# Altium project Task_Tony.PrjPcb (part 4 of 8)

## Sheet USB_Host.SchDoc
size A4; DocumentNumber: 25; SheetNumber: 25; SheetTotal: 28
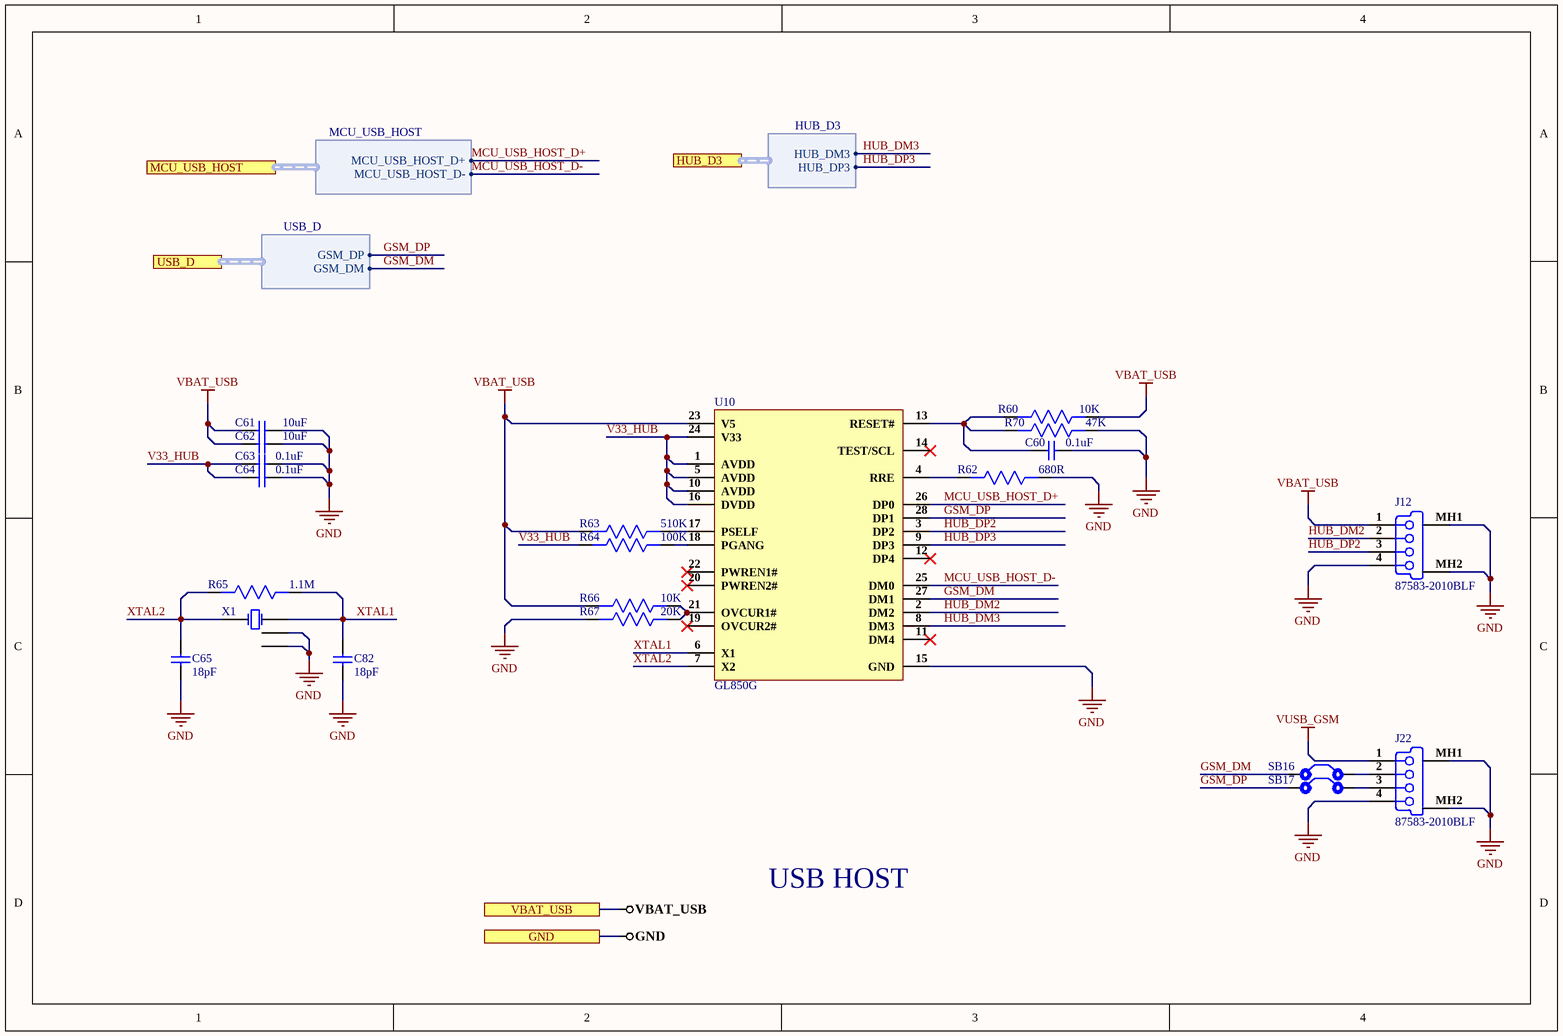
[diagram p18: USB_Host.SchDoc]

### Parts
C60  0.1uF  [Cap0603]
C61  10uF  [Cap0603]
C62  10uF  [Cap0603]
C63  0.1uF  [Cap0603]
C64  0.1uF  [Cap0603]
C65  18pF  [Cap0603]
C82  18pF  [Cap0603]
J12  87583-2010BLF  [87583-2010BLF]
J22  87583-2010BLF  [87583-2010BLF]
R60  10K  [Res0603]
R62  680R  [Res0603]
R63  510K  [Res0603]
R64  100K  [Res0603]
R65  1.1M  [Res0603]
R66  10K  [Res0603]
R67  20K  [Res0603]
R70  47K  [Res-0201]
SB16  Solder Bridge  [Solder Bridge]  (value not drawn)
SB17  Solder Bridge  [Solder Bridge]  (value not drawn)
U10  GL850G  [SSOP-28]
X1  8Z-12.000MAAJ-T  [8Z-12.000MAAJ-T]  (value not drawn)

### Ports
GND, HUB_D3 (harness HUB_D3), MCU_USB_HOST (harness MCU_USB_HOST), USB_D (harness USB_D), VBAT_USB

### Harnesses
MCU_USB_HOST: MCU_USB_HOST_D+, MCU_USB_HOST_D-
HUB_D3: HUB_DM3, HUB_DP3
USB_D: GSM_DP, GSM_DM

### Nets
GND: C60.2 C61.2 C62.2 C63.2 C64.2 C65.1 C82.1 J12.4(GND) J12.MH1(Tab) J12.MH2(Tab) J22.4(GND) J22.MH1(Tab) J22.MH2(Tab) R62.1 R67.2 R70.1 U10.15(GND) X1.2(GND) X1.4(GND) ; port GND
VBAT_USB: C61.1 C62.1 J12.1(V_BUS_(5V)) R60.1 R63.2 R66.2 U10.23(V5) ; port VBAT_USB
VUSB_GSM: J22.1(V_BUS_(5V))
GSM_DM: SB16.1 U10.27(DM1) ; port USB_D.GSM_DM
GSM_DP: SB17.1 U10.28(DP1) ; port USB_D.GSM_DP
HUB_DM2: J12.2(D-) U10.2(DM2)
HUB_DM3: U10.8(DM3) ; port HUB_D3.HUB_DM3  [project net HUB_D3.HUB_DM3]
HUB_DP2: J12.3(D+) U10.3(DP2)
HUB_DP3: U10.9(DP3) ; port HUB_D3.HUB_DP3  [project net HUB_D3.HUB_DP3]
MCU_USB_HOST_D+: U10.26(DP0) ; port MCU_USB_HOST.MCU_USB_HOST_D+  [project net MCU_USB_HOST.MCU_USB_HOST_D+]
MCU_USB_HOST_D-: U10.25(DM0) ; port MCU_USB_HOST.MCU_USB_HOST_D-  [project net MCU_USB_HOST.MCU_USB_HOST_D-]
V33_HUB: C63.1 C64.1 R64.2 U10.1(AVDD) U10.5(AVDD) U10.10(AVDD) U10.16(DVDD) U10.24(V33)
XTAL1: C82.2 R65.1 U10.6(X1) X1.1(OSC1)
XTAL2: C65.2 R65.2 U10.7(X2) X1.3(OSC2)
NetC60_1: C60.1 R60.2 R70.2 U10.13(RESET#)
NetJ22_2: J22.2(D-) SB16.2
NetJ22_3: J22.3(D+) SB17.2
NetR62_2: R62.2 U10.4(RRE)
NetR63_1: R63.1 U10.17(PSELF)
NetR64_1: R64.1 U10.18(PGANG)
NetR66_1: R66.1 R67.1 U10.21(OVCUR1#)

Not connected (* = marked no-connect by the designer): U10 11(DM4)* 12(DP4)* 14(TEST/SCL)* 19(OVCUR2#)* 20(PWREN2#)* 22(PWREN1#)*

### Notes on the sheet
- USB HOST

### Library data of the parts
C60 C63 C64 = CC0603ZRY5V9BB104: as C40 on sheet USB_Power; Supplier 1: Digi-Key; Manufacturer Part Number: CC0603ZRY5V9BB104; Stock 1: 15000880; Pricing 1: 1=0.1, 10=0.075, 100=0.0334, 500=0.02386, 1000=0.01874 (USD); Mount: Surface Mount; Case/Package: 0603; Number of Pins: 2; Case Code (Metric): 1608; Case Code (Imperial): 0603; Min Operating Temperature: -30°C; Max Operating Temperature: 85°C; Dielectric: Y5V; Voltage Rating: 50V; Package Quantity: 1; Packaging: Tape and Reel; Voltage Rating (DC): 50V; Termination: SMD/SMT; Composition: Ceramic; Voltage: 50V; Length: 1.6mm; Height: 0.8mm; Width: 0.031inch; Thickness: 0.035inch; Depth: 0.8mm; Radiation Hardening: No; REACH SVHC: No SVHC; Lead Free: Lead Free; Halogen Free: Halogen Free; ComponentLink1URL: http://www.yageo.com/documents/recent/UPY-GPHC_Y5V_6.3V-to-50V_8.pdf?src-supplier=Digi-Key; ComponentLink1Description: http://www.yageo.com/documents/recent/UPY-GPHC_Y5V_6.3V-to-50V_8.pdf?src-supplier=Digi-Key; ComponentLink2URL: http://www.yageo.com/documents/recent/UPY-GPHC_Y5V_6.3V-to-50V_5.pdf?src-supplier=Avnet+Europe; ComponentLink2Description: http://www.yageo.com/documents/recent/UPY-GPHC_Y5V_6.3V-to-50V_5.pdf?src-supplier=Avnet+Europe; ComponentLink3URL: https://www.verical.com/server-webapp/html/getDatasheet?partID=403611&src-supplier=Verical; ComponentLink3Description: https://www.verical.com/server-webapp/html/getDatasheet?partID=403611&src-supplier=Verical; ComponentLink4URL: http://www.mouser.com/ds/2/447/Yageo_UPY-GP_NP0_16V-to-50V_9-358835.pdf?src-supplier=Mouser; ComponentLink4Description: http://www.mouser.com/ds/2/447/Yageo_UPY-GP_NP0_16V-to-50V_9-358835.pdf?src-supplier=Mouser; ComponentLink5URL: http://www.farnell.com/datasheets/1132289.pdf?src-supplier=Element14; ComponentLink5Description: http://www.farnell.com/datasheets/1132289.pdf?src-supplier=Element14; Supplier Part Number 1: 311-1343-1-ND
C61 C62 = GRM188R6YA106MA73D: as C89 on sheet USB_Power; Supplier 1: Digi-Key; Manufacturer Part Number: GRM188R6YA106MA73D; Stock 1: 11640; Pricing 1: 1=0.5, 10=0.346, 100=0.2076, 500=0.1557, 1000=0.13148 (USD); Mount: Surface Mount; Case/Package: 0603; Case Code (Metric): 1608; Case Code (Imperial): 0603; Min Operating Temperature: -55°C; Max Operating Temperature: 85°C; Packaging: Tape and Reel; Capacitance: 10uF; Voltage Rating: 35V; Voltage Rating (DC): 35V; Dielectric: X5R; Length: 0.063inch; Width: 0.031inch; Thickness: 0.039inch; ComponentLink1URL: http://search.murata.co.jp/Ceramy/image/img/A01X/G101/ENG/GRM188R6YA106MA73-01.pdf?src-supplier=Digi-Key; ComponentLink1Description: http://search.murata.co.jp/Ceramy/image/img/A01X/G101/ENG/GRM188R6YA106MA73-01.pdf?src-supplier=Digi-Key; ComponentLink2URL: http://search.murata.co.jp/Ceramy/image/img/A01X/G101/ENG/GRM188R6YA106MA73-01.pdf?src-supplier=Mouser; ComponentLink2Description: http://search.murata.co.jp/Ceramy/image/img/A01X/G101/ENG/GRM188R6YA106MA73-01.pdf?src-supplier=Mouser; ComponentLink3URL: https://www.murata.com/~/media/webrenewal/support/library/catalog/products/capacitor/mlcc/c02e.ashx?la=en-us&src-supplier=Digi-Key; ComponentLink3Description: https://www.murata.com/~/media/webrenewal/support/library/catalog/products/capacitor/mlcc/c02e.ashx?la=en-us&src-supplier=Digi-Key; ComponentLink4URL: http://search.murata.co.jp/Ceramy/image/img/A01X/G101/ENG/GRM188R6YA106MA73-01.pdf?src-supplier=Future+Electronics; ComponentLink4Description: http://search.murata.co.jp/Ceramy/image/img/A01X/G101/ENG/GRM188R6YA106MA73-01.pdf?src-supplier=Future+Electronics; ComponentLink5URL: http://search.murata.co.jp/Ceramy/image/img/A01X/G101/ENG/GRM188R6YA106MA73-01.pdf?src-supplier=TTI; ComponentLink5Description: http://search.murata.co.jp/Ceramy/image/img/A01X/G101/ENG/GRM188R6YA106MA73-01.pdf?src-supplier=TTI; Supplier Part Number 1: 490-13248-6-ND
C65 C82 = C0603C180J5GACTU: CAP CER 18PF 50V C0G/NP0 0603; Manufacturer: KEMET; Dielectric Material: Ceramic; Tolerance: 5%; Dielectric: C0G; Dissipation Factor: 0.1%; Temperature Coefficient: 30ppm/°C; Supplier 1: Digi-Key; Manufacturer Part Number: C0603C180J5GACTU; Stock 1: 196781; Pricing 1: 1=0.1, 10=0.049, 100=0.0217, 500=0.01552, 1000=0.01219 (USD); Mount: Surface Mount; Case/Package: 0603; Case Code (Imperial): 0603; Case Code (Metric): 1608; Min Operating Temperature: -55°C; Max Operating Temperature: 125°C; Packaging: Tape and Reel; Capacitance: 18pF; Package Quantity: 4000; Voltage Rating: 50V; Voltage Rating (DC): 50V; Termination: SMD/SMT; Voltage: 50V; Length: 1.6mm; Height: 0.8mm; Width: 0.8mm; Depth: 0.8mm; Radiation Hardening: No; Lead Free: Lead Free; ComponentLink1URL: http://www.kemet.com/kemet/web/homepage/kechome.nsf/file/F9080B_0402_Series_C0G/$file/F9080B_0402_Series_C0G.pdf?src-supplier=Element14; ComponentLink1Description: http://www.kemet.com/kemet/web/homepage/kechome.nsf/file/F9080B_0402_Series_C0G/$file/F9080B_0402_Series_C0G.pdf?src-supplier=Element14; ComponentLink2URL: http://www.farnell.com/datasheets/1372242.pdf?src-supplier=Element14; ComponentLink2Description: http://www.farnell.com/datasheets/1372242.pdf?src-supplier=Element14; Supplier Part Number 1: 399-1052-1-ND
J12 J22 = 87583-2010BLF: USB Connectors 4P RECEPTACLE TYPE A; Manufacturer: Amphenol FCI; Plating: Nickel; Number of Terminals/Pins: 4; Current Rating: 1A; Mating Cycles: 1500; Connector Type: USB,Receptacle; Number of Ports: 1; Contact Resistance: 30mR; Insulation Resistance: 1GR; USB Standard: USB 2.0; Supplier 1: Allied Electronics; Manufacturer Part Number: 87583-2010BLF; RoHS: Yes; Category: Connectors; Mount: Surface Mount,Horizontal; Contact Plating: GXT,Gold; Color: White; Contact Material: Copper Alloy; Body Plating: Nickel; Material: Tin; Housing Material: Thermoplastic; Min Operating Temperature: 0°C; Max Operating Temperature: 40°C; Termination: Solder; Gender: Receptacle; Packaging: Rail/Tube; Number of Contacts: 4; Orientation: Right Angle; Package Quantity: 42; Interface: USB; Number of Positions: 4; Series: 87583; Length: 14.5mm; Depth: 14mm; Radiation Hardening: No; Flammability Rating: UL94 V-0; REACH SVHC: No SVHC; RoHS Compliant: Yes; ComponentLink1URL: https://datasheet.ciiva.com/851/87583-851211.pdf?src-supplier=Digi-Key; ComponentLink1Description: https://datasheet.ciiva.com/851/87583-851211.pdf?src-supplier=Digi-Key; ComponentLink2URL: https://datasheet.ciiva.com/1100/57319-1100818.pdf?src-supplier=Newark; ComponentLink2Description: https://datasheet.ciiva.com/1100/57319-1100818.pdf?src-supplier=Newark; ComponentLink3URL: https://datasheet.ciiva.com/25614/0900766b8118e6e2-25614557.pdf?src-supplier=RSComponents; ComponentLink3Description: https://datasheet.ciiva.com/25614/0900766b8118e6e2-25614557.pdf?src-supplier=RSComponents; ComponentLink4URL: https://datasheet.ciiva.com/4599/gs-12-095-532824-4599287.pdf?src-supplier=Mouser; ComponentLink4Description: https://datasheet.ciiva.com/4599/gs-12-095-532824-4599287.pdf?src-supplier=Mouser; ComponentLink5URL: https://datasheet.ciiva.com/15181/getdatasheetpartid-106468-15181159.pdf?src-supplier=Verical; ComponentLink5Description: https://datasheet.ciiva.com/15181/getdatasheetpartid-106468-15181159.pdf?src-supplier=Verical; ComponentLink6URL: https://datasheet.ciiva.com/3094/87583-3094440.pdf?src-supplier=Avnet; ComponentLink6Description: https://datasheet.ciiva.com/3094/87583-3094440.pdf?src-supplier=Avnet; ComponentLink7URL: https://datasheet.ciiva.com/14619/70236897-14619037.pdf?src-supplier=Allied+Electronics; ComponentLink7Description: https://datasheet.ciiva.com/14619/70236897-14619037.pdf?src-supplier=Allied+Electronics; Supplier Part Number 1: 70236897
R60 R66 = AC0603JR-0710KL: RES SMD 10K OHM 5% 1/10W 0603; Manufacturer: Yageo; Voltage Rating: 50V; Resistance: 10kR; Power Rating: 100mW; Temperature Coefficient: 100ppm/°C; Supplier 1: Future Electronics; Manufacturer Part Number: AC0603JR-0710KL; RoHS: Yes; Category: Chip SMD Resistors; Stock 1: 1533000; Pricing 1: 5000=0.00540 (USD); Case/Package: 0603; Case Code (Imperial): 0603; Case Code (Metric): 1608; Size Code: 0603; Min Operating Temperature: -55°C; Max Operating Temperature: 155°C; Packaging: Tape and Reel; Tolerance: 5%; Package Quantity: 1; Resistor Type: Thick Film; Termination: SMD/SMT; Number of Terminations: 2; Max Power Dissipation: 100mW; Features: Moisture Resistant,Automotive AEC-Q200,Anti-Sulfur; Series: AC; Construction: Rectangular; Length: 0.063inch; Width: 0.031inch; Height: 0.022inch; Depth: 0.8mm; Military Standard: Not; Lead Free: Lead Free; RoHS Compliant: Yes; ComponentLink1URL: https://datasheet.ciiva.com/5562/pyu-ac-51-rohs-l-2-5562553.pdf?src-supplier=Mouser; ComponentLink1Description: https://datasheet.ciiva.com/5562/pyu-ac-51-rohs-l-2-5562553.pdf?src-supplier=Mouser; Supplier Part Number 1: 1029044
R62 = RC0603FR-07680RL: RES SMD 680 OHM 1% 1/10W 0603; Manufacturer: Yageo; Temperature Coefficient: 100ppm/°C; Voltage Rating (DC): 50V; Power Rating: 100mW; Supplier 1: Digi-Key; Manufacturer Part Number: RC0603FR-07680RL; Stock 1: 4278227; Pricing 1: 1=0.1, 10=0.024, 100=0.0097, 1000=0.00437, 2500=0.00379 (USD); Case/Package: 0603; Number of Pins: 2; Case Code (Imperial): 0603; Case Code (Metric): 1608; Min Operating Temperature: -55°C; Max Operating Temperature: 155°C; Resistance: 680R; Tolerance: 1%; Composition: Thick Film; Packaging: Tape and Reel; Number of Terminations: 2; Military Standard: Not; Voltage Rating: 50V; Package Quantity: 1; Termination: SMD/SMT; Max Power Dissipation: 100mW; Features: Moisture Resistant; Length: 1.6mm; Height: 0.022inch; Width: 0.031inch; Depth: 0.8mm; REACH SVHC: No SVHC; Lead Free: Lead Free; ComponentLink1URL: http://www.farnell.com/datasheets/1868787.pdf?src-supplier=Element14; ComponentLink1Description: http://www.farnell.com/datasheets/1868787.pdf?src-supplier=Element14; ComponentLink2URL: http://documents.rs-components.com/techlib://itc_doclist_GB.htm?stockno=5048221&src-supplier=RSComponents; ComponentLink2Description: http://documents.rs-components.com/techlib://itc_doclist_GB.htm?stockno=5048221&src-supplier=RSComponents; ComponentLink3URL: http://www.farnell.com/datasheets/443971.pdf?src-supplier=Element14; ComponentLink3Description: http://www.farnell.com/datasheets/443971.pdf?src-supplier=Element14; ComponentLink4URL: http://www.yageo.com/documents/recent/PYu-RC_Group_51_RoHS_L_10.pdf?src-supplier=Digi-Key; ComponentLink4Description: http://www.yageo.com/documents/recent/PYu-RC_Group_51_RoHS_L_10.pdf?src-supplier=Digi-Key; Supplier Part Number 1: 311-680HRCT-ND
R63 = RK73B1JTTD514J: RES 510K OHM 5% 1/10W 0603; Manufacturer: KOA Speer; Resistance: 510kR; Power Rating: 100mW; Voltage Rating: 50V; Temperature Coefficient: 200ppm/°C; Supplier 1: Digi-Key; Manufacturer Part Number: RK73B1JTTD514J; RoHS: Yes; Category: Chip SMD Resistors; Stock 1: 50000; Pricing 1: 1=0.10000, 10=0.01400, 100=0.00580, 1000=0.00262, 2500=0.00228 (USD); Case/Package: 0603; Case Code (Imperial): 0603; Case Code (Metric): 1608; Min Operating Temperature: -55°C; Max Operating Temperature: 155°C; Packaging: Tape and Reel; Tolerance: 5%; Package Quantity: 5000; Resistor Type: Thick Film; Termination: SMD/SMT; Voltage Rating (DC): 50V; Series: RK73B; Technology: THICK FILM; Resistance Tolerance: 5%; Construction: Rectangular; Length: 1.6mm; Width: 0.8mm; Height: 0.45mm; Depth: 0.8mm; REACH SVHC: Unknown; Military Standard: Not; Lead Free: Lead Free; RoHS Compliant: Yes; ComponentLink1URL: https://datasheet.ciiva.com/5555/rk73b-5555496.pdf?src-supplier=Mouser; ComponentLink1Description: https://datasheet.ciiva.com/5555/rk73b-5555496.pdf?src-supplier=Mouser; ComponentLink2URL: https://datasheet.ciiva.com/7763/548635-7763065.pdf?src-supplier=Element14; ComponentLink2Description: https://datasheet.ciiva.com/7763/548635-7763065.pdf?src-supplier=Element14; ComponentLink3URL: https://datasheet.ciiva.com/15202/getdatasheetpartid-423620-15202714.pdf?src-supplier=Verical; ComponentLink3Description: https://datasheet.ciiva.com/15202/getdatasheetpartid-423620-15202714.pdf?src-supplier=Verical; Supplier Part Number 1: 2019-RK73B1JTTD514JCT-ND
R64 = CRGH0603J100K: RES SMD 100K OHM 5% 1/5W 0603; Manufacturer: TE Connectivity; Resistance: 100kR; Temperature Coefficient: 100ppm/°C; Power Rating: 200mW; Voltage Rating: 50V; Number of Resistors: 1; Supplier 1: Digi-Key; Manufacturer Part Number: CRGH0603J100K; Stock 1: 23277; Pricing 1: 1=0.1, 10=0.049, 100=0.02, 1000=0.00899, 2500=0.0078 (USD); Mount: Surface Mount; Case/Package: 0603; Case Code (Imperial): 0603; Case Code (Metric): 1608; Min Operating Temperature: -55°C; Max Operating Temperature: 125°C; Tolerance: 5%; Packaging: Tape and Reel; Resistor Type: Thick Film,Power resistor; Number of Terminations: 2; Series: CRGH; Termination: Solder; Voltage Rating (DC): 50V; Resistance Tolerance: 5%; Technology: THICK FILM; Length: 1.6mm; Width: 0.8mm; Height: 0.45mm; Depth: 0.8mm; RoHS Compliant: Yes; REACH SVHC: No SVHC; ELV: Compliant; ComponentLink1URL: http://www.farnell.com/datasheets/2007183.pdf?src-supplier=Element14; ComponentLink1Description: http://www.farnell.com/datasheets/2007183.pdf?src-supplier=Element14; Supplier Part Number 1: A126393DKR-ND
R65 = RC0603FR-071M1L: RES SMD 1.1M OHM 1% 1/10W 0603; Manufacturer: Yageo; Resistance: 1.1MR; Temperature Coefficient: 100ppm/°C; Power Rating: 100mW; Voltage Rating: 50V; Supplier 1: Digi-Key; Manufacturer Part Number: RC0603FR-071M1L; RoHS: Yes; Category: Chip SMD Resistors; Stock 1: 137699; Pricing 1: 1=0.10000, 10=0.02400, 100=0.00970, 1000=0.00436, 2500=0.00378 (USD); Mount: Surface Mount; Case/Package: 0603; Contact Plating: Tin,Matte; Case Code (Imperial): 0603; Case Code (Metric): 1608; Size Code: 0603; Min Operating Temperature: -55°C; Max Operating Temperature: 155°C; Tolerance: 1%; Resistor Type: Thick Film; Packaging: Tape and Reel; Number of Terminations: 2; Termination: SMD/SMT; Max Power Dissipation: 100mW; Features: Moisture Resistant; Series: RC; Technology: THICK FILM; Construction: Rectangular; Length: 1.6mm; Width: 0.031inch; Height: 0.45mm; Depth: 0.8mm; Military Standard: Not; Lead Free: Lead Free; RoHS Compliant: Yes; ComponentLink1URL: https://datasheet.ciiva.com/11808/0900766b80c66297-11808821.pdf?src-supplier=RSComponents; ComponentLink1Description: https://datasheet.ciiva.com/11808/0900766b80c66297-11808821.pdf?src-supplier=RSComponents; ComponentLink2URL: https://datasheet.ciiva.com/28419/pyu-rc0603-51-rohs-l-4-28419097.pdf?src-supplier=Avnet+Europe; ComponentLink2Description: https://datasheet.ciiva.com/28419/pyu-rc0603-51-rohs-l-4-28419097.pdf?src-supplier=Avnet+Europe; ComponentLink3URL: https://datasheet.ciiva.com/12560/rc0603-272842-12560493.pdf?src-supplier=Mouser; ComponentLink3Description: https://datasheet.ciiva.com/12560/rc0603-272842-12560493.pdf?src-supplier=Mouser; Supplier Part Number 1: YAG3324CT-ND
R67 = ESR03EZPF2002: RES SMD 20K OHM 1% 1/4W 0603; Manufacturer: Rohm; Resistance: 20kR; Max Power Dissipation: 250mW; Temperature Coefficient: 100ppm/°C; Supplier 1: Digi-Key; Manufacturer Part Number: ESR03EZPF2002; Stock 1: 4737; Pricing 1: 1=0.13, 10=0.12, 100=0.046, 1000=0.02024, 2500=0.01748 (USD); Case/Package: 0603; Case Code (Metric): 1608; Case Code (Imperial): 0603; Min Operating Temperature: -55°C; Max Operating Temperature: 155°C; Package Quantity: 1; Tolerance: 1%; Packaging: Tape and Reel; Resistor Type: Thick Film; Number of Terminations: 2; Features: Automotive AEC-Q200; Series: ESR; Length: 0.063inch; Width: 0.031inch; Height: 0.022inch; RoHS Compliant: Yes; ComponentLink1URL: https://www.rohm.com/datasheet/ESR01MZPF/esr-e?src-supplier=Digi-Key; ComponentLink1Description: https://www.rohm.com/datasheet/ESR01MZPF/esr-e?src-supplier=Digi-Key; Supplier Part Number 1: RHM20.0KADCT-ND
R70 = RC0201JR-0747KL: RES SMD 47K OHM 5% 1/20W 0201; Manufacturer: Yageo; Resistance: 47kR; Temperature Coefficient: 200ppm/°C; Voltage Rating: 25V; Power Rating: 50mW; Supplier 1: Digi-Key; Manufacturer Part Number: RC0201JR-0747KL; RoHS: Yes; Category: Chip SMD Resistors; Stock 1: 472205; Pricing 1: 1=0.10000, 10=0.02800, 100=0.01140, 1000=0.00513, 2500=0.00445, 5000=0.00368 (USD); Case/Package: 0201; Number of Pins: 2; Contact Plating: Tin,Matte; Case Code (Metric): 0603; Case Code (Imperial): 0201; Min Operating Temperature: -55°C; Max Operating Temperature: 125°C; Tolerance: 5%; Resistor Type: Thick Film; Package Quantity: 10000; Packaging: Tape and Reel; Number of Terminations: 2; Termination: SMD/SMT; Max Power Dissipation: 50mW; Voltage Rating (DC): 25V; Working Voltage: 25V; Features: Moisture Resistant; Series: RC; Resistance Tolerance: 5%; Construction: Rectangular; Technology: THICK FILM; Length: 0.6mm; Width: 0.3mm; Height: 0.01inch; Depth: 0.3mm; Radiation Hardening: No; REACH SVHC: No SVHC; Military Standard: Not; Lead Free: Lead Free; RoHS Compliant: Yes; ComponentLink1URL: https://datasheet.ciiva.com/2492/pyu-r-int-thick-7-2492966.pdf?src-supplier=Digi-Key; ComponentLink1Description: https://datasheet.ciiva.com/2492/pyu-r-int-thick-7-2492966.pdf?src-supplier=Digi-Key; ComponentLink2URL: https://datasheet.ciiva.com/5989/1563626-5989624.pdf?src-supplier=Farnell; ComponentLink2Description: https://datasheet.ciiva.com/5989/1563626-5989624.pdf?src-supplier=Farnell; ComponentLink3URL: https://datasheet.ciiva.com/28399/pyu-rc0201-51-rohs-l-8-28399338.pdf?src-supplier=Avnet+Europe; ComponentLink3Description: https://datasheet.ciiva.com/28399/pyu-rc0201-51-rohs-l-8-28399338.pdf?src-supplier=Avnet+Europe; ComponentLink4URL: https://datasheet.ciiva.com/8889/pyu-rc0201-51-rohs-l-8-8889071.pdf?src-supplier=Avnet; ComponentLink4Description: https://datasheet.ciiva.com/8889/pyu-rc0201-51-rohs-l-8-8889071.pdf?src-supplier=Avnet; ComponentLink5URL: https://datasheet.ciiva.com/2492/pyu-r-int-thick-7-2492965.pdf?src-supplier=Digi-Key; ComponentLink5Description: https://datasheet.ciiva.com/2492/pyu-r-int-thick-7-2492965.pdf?src-supplier=Digi-Key; ComponentLink6URL: https://datasheet.ciiva.com/2492/pyu-r-int-thick-7-2492967.pdf?src-supplier=Digi-Key; ComponentLink6Description: https://datasheet.ciiva.com/2492/pyu-r-int-thick-7-2492967.pdf?src-supplier=Digi-Key; ComponentLink7URL: https://datasheet.ciiva.com/16855/pyu-rc0201-51-rohs-l-8-16855517.pdf?src-supplier=Avnet+Europe; ComponentLink7Description: https://datasheet.ciiva.com/16855/pyu-rc0201-51-rohs-l-8-16855517.pdf?src-supplier=Avnet+Europe; Supplier Part Number 1: 311-47KNCT-ND
SB16 SB17 = Solder Bridge: Solder Bridge ON
U10 = GL850G: USB 2.0 Hub Controller
X1 = 8Z-12.000MAAJ-T: CRYSTAL 12.0000MHZ 18PF SMD; Manufacturer: TXC; Frequency: 12MHz; Frequency Tolerance: 30ppm; ESR (Equivalent Series Resistance): 150R; Supplier 1: Mouser; Manufacturer Part Number: 8Z-12.000MAAJ-T; RoHS: Yes; Category: Crystals; Stock 1: 33; Pricing 1: 1=1.41000, 10=1.36000, 50=1.33000, 100=1.13000, 1000=0.93000, 10000=0.78000 (USD); Mount: Surface Mount; Case/Package: SMD/SMT; Number of Pins: 4; Min Operating Temperature: -20°C; Max Operating Temperature: 70°C; Package Quantity: 1; Load Capacitance: 18pF; Packaging: Tape and Reel; Tolerance: 30ppm; Frequency Stability: 30ppm; Termination: SMD/SMT; Series: 8Z; Length: 2.5mm; Width: 0.079inch; Height: 0.022inch; Depth: 2mm; REACH SVHC: No SVHC; RoHS Compliant: Yes; ComponentLink1URL: https://datasheet.ciiva.com/28498/1838674-28498900.pdf?src-supplier=Element14; ComponentLink1Description: https://datasheet.ciiva.com/28498/1838674-28498900.pdf?src-supplier=Element14; ComponentLink2URL: https://datasheet.ciiva.com/4950/8z-12784-4950167.pdf?src-supplier=Mouser; ComponentLink2Description: https://datasheet.ciiva.com/4950/8z-12784-4950167.pdf?src-supplier=Mouser; ComponentLink3URL: https://datasheet.ciiva.com/859/8z-859073.pdf?src-supplier=Digi-Key; ComponentLink3Description: https://datasheet.ciiva.com/859/8z-859073.pdf?src-supplier=Digi-Key; ComponentLink4URL: https://datasheet.ciiva.com/859/8z-859071.pdf?src-supplier=Digi-Key; ComponentLink4Description: https://datasheet.ciiva.com/859/8z-859071.pdf?src-supplier=Digi-Key; ComponentLink5URL: https://datasheet.ciiva.com/859/8z-859072.pdf?src-supplier=Digi-Key; ComponentLink5Description: https://datasheet.ciiva.com/859/8z-859072.pdf?src-supplier=Digi-Key; ComponentLink6URL: https://datasheet.ciiva.com/8047/1041872-8047871.pdf?src-supplier=Element14; ComponentLink6Description: https://datasheet.ciiva.com/8047/1041872-8047871.pdf?src-supplier=Element14; Supplier Part Number 1: 717-8Z-12.000MAAJ-T

## Sheet Camera_Section.SchDoc
size A4; DocumentNumber: 18; SheetNumber: 18; SheetTotal: 28
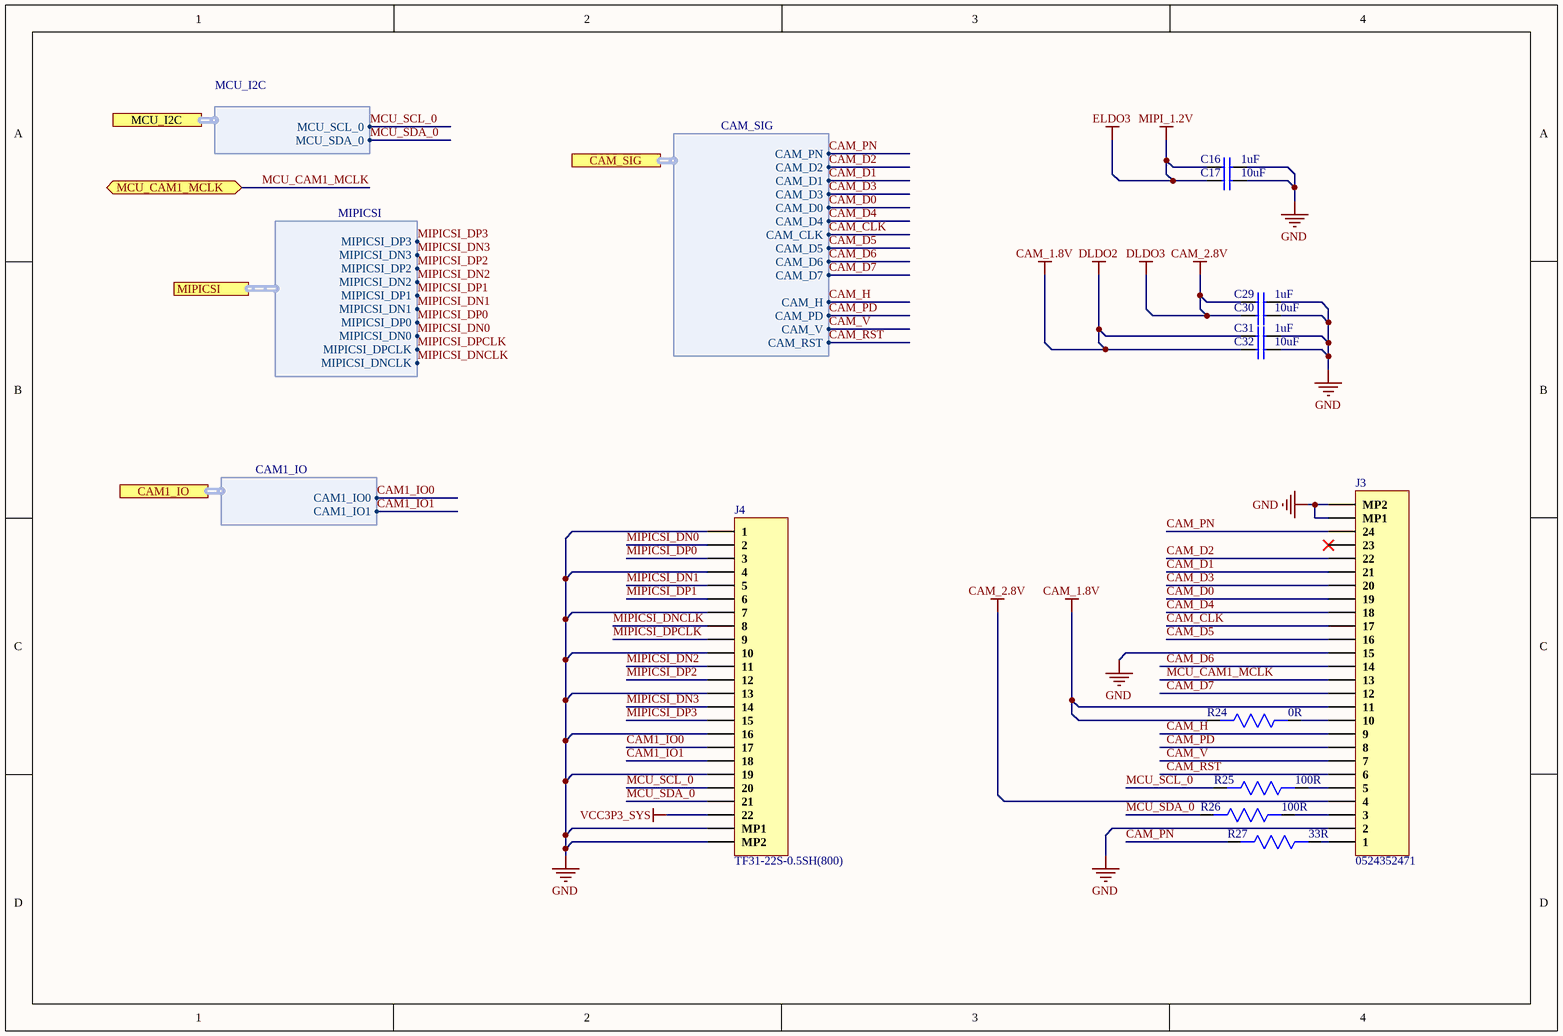
[diagram p19: Camera_Section.SchDoc]

### Parts
C16  1uF  [Cap0603]
C17  10uF  [Cap0603]
C29  1uF  [Cap0603]
C30  10uF  [Cap0603]
C31  1uF  [Cap0603]
C32  10uF  [Cap0603]
J3  0524352471  [0524352471]
J4  TF31-22S-0.5SH(800)  [TF31-22S-0.5SH(800)]
R24  0R  [Res0603]
R25  100R  [Res0603]
R26  100R  [Res0603]
R27  33R  [Res0603]

### Ports
CAM1_IO (harness CAM1_IO), CAM_SIG (harness CAM_SIG), MCU_CAM1_MCLK (bidir), MCU_I2C (harness MCU_I2C), MIPICSI (harness MIPICSI)

### Harnesses
MCU_I2C: MCU_SCL_0, MCU_SDA_0
CAM_SIG: CAM_PN, CAM_D2, CAM_D1, CAM_D3, CAM_D4, CAM_D5, CAM_D6, CAM_D7, CAM_H, CAM_PD, CAM_V, CAM_RST, CAM_CLK, CAM_D0
MIPICSI: MIPICSI_DP3, MIPICSI_DN3, MIPICSI_DP2, MIPICSI_DN2, MIPICSI_DP1, MIPICSI_DN1, MIPICSI_DP0, MIPICSI_DN0, MIPICSI_DPCLK, MIPICSI_DNCLK
CAM1_IO: CAM1_IO0, CAM1_IO1

### Nets
CAM_1.8V: C31.1 C32.1 J3.11 R24.2  [also labelled DLDO2]
CAM_2.8V: C29.1 C30.1 J3.4  [also labelled DLDO3]
ELDO3: C16.1 C17.1  [also labelled MIPI_1.2V]
GND: C16.2 C17.2 C29.2 C30.2 C31.2 C32.2 J3.2 J3.15 J3.MP1 J3.MP2 J4.1 J4.4 J4.7 J4.10 J4.13 J4.16 J4.19 J4.MP1 J4.MP2
VCC3P3_SYS: J4.22  [project net VCC 3P3_SYS]
CAM1_IO0: J4.17 ; port CAM1_IO.CAM1_IO0  [project net CAM1_IO.CAM1_IO0]
CAM1_IO1: J4.18 ; port CAM1_IO.CAM1_IO1  [project net CAM1_IO.CAM1_IO1]
CAM_CLK: J3.17 ; port CAM_SIG.CAM_CLK
CAM_D0: J3.19 ; port CAM_SIG.CAM_D0
CAM_D1: J3.21 ; port CAM_SIG.CAM_D1
CAM_D2: J3.22 ; port CAM_SIG.CAM_D2
CAM_D3: J3.20 ; port CAM_SIG.CAM_D3
CAM_D4: J3.18 ; port CAM_SIG.CAM_D4
CAM_D5: J3.16 ; port CAM_SIG.CAM_D5
CAM_D6: J3.14 ; port CAM_SIG.CAM_D6
CAM_D7: J3.12 ; port CAM_SIG.CAM_D7
CAM_H: J3.9 ; port CAM_SIG.CAM_H
CAM_PD: J3.8 ; port CAM_SIG.CAM_PD
CAM_PN: J3.24 R27.2 ; port CAM_SIG.CAM_PN
CAM_RST: J3.6 ; port CAM_SIG.CAM_RST
CAM_V: J3.7 ; port CAM_SIG.CAM_V  [project net CAM_SIG.CAM_V]
MCU_CAM1_MCLK: J3.13 ; port MCU_CAM1_MCLK
MCU_SCL_0: J4.20 R25.2 ; port MCU_I2C.MCU_SCL_0  [project net MCU_I2C.MCU_SCL_0]
MCU_SDA_0: J4.21 R26.2 ; port MCU_I2C.MCU_SDA_0  [project net MCU_I2C.MCU_SDA_0]
MIPICSI_DN0: J4.2 ; port MIPICSI.MIPICSI_DN0  [project net MIPICSI.MIPICSI_DN0]
MIPICSI_DN1: J4.5 ; port MIPICSI.MIPICSI_DN1  [project net MIPICSI.MIPICSI_DN1]
MIPICSI_DN2: J4.11 ; port MIPICSI.MIPICSI_DN2  [project net MIPICSI.MIPICSI_DN2]
MIPICSI_DN3: J4.14 ; port MIPICSI.MIPICSI_DN3  [project net MIPICSI.MIPICSI_DN3]
MIPICSI_DNCLK: J4.8 ; port MIPICSI.MIPICSI_DNCLK  [project net MIPICSI.MIPICSI_DNCLK]
MIPICSI_DP0: J4.3 ; port MIPICSI.MIPICSI_DP0  [project net MIPICSI.MIPICSI_DP0]
MIPICSI_DP1: J4.6 ; port MIPICSI.MIPICSI_DP1  [project net MIPICSI.MIPICSI_DP1]
MIPICSI_DP2: J4.12 ; port MIPICSI.MIPICSI_DP2  [project net MIPICSI.MIPICSI_DP2]
MIPICSI_DP3: J4.15 ; port MIPICSI.MIPICSI_DP3  [project net MIPICSI.MIPICSI_DP3]
MIPICSI_DPCLK: J4.9 ; port MIPICSI.MIPICSI_DPCLK  [project net MIPICSI.MIPICSI_DPCLK]
NetJ3_1: J3.1 R27.1
NetJ3_3: J3.3 R26.1
NetJ3_5: J3.5 R25.1
NetJ3_10: J3.10 R24.1

Not connected (* = marked no-connect by the designer): J3 23*

### Library data of the parts
C16 C29 C31 = CC0603KRX5R8BB105: CAP CER 1UF 25V X5R 0603; Manufacturer: Yageo; Tolerance: 10%; Supplier 1: Digi-Key; Manufacturer Part Number: CC0603KRX5R8BB105; Stock 1: 459947; Pricing 1: 1=0.1, 10=0.076, 100=0.0337, 500=0.0241, 1000=0.01894 (USD); Mount: Surface Mount; Case/Package: 0603; Number of Pins: 2; Case Code (Metric): 1608; Case Code (Imperial): 0603; Min Operating Temperature: -55°C; Max Operating Temperature: 85°C; Capacitance: 1uF; Dielectric: X5R; Package Quantity: 1; Voltage Rating: 25V; Packaging: Tape and Reel; Termination: SMD/SMT; Voltage Rating (DC): 25V; Length: 1.6mm; Height: 0.8mm; Width: 0.031inch; Thickness: 0.035inch; Depth: 0.8mm; Radiation Hardening: No; REACH SVHC: No SVHC; Lead Free: Lead Free; Halogen Free: Halogen Free; ComponentLink1URL: http://www.yageo.com/documents/recent/UPY-GPHC_X5R_4V-to-50V_25.pdf?src-supplier=Digi-Key; ComponentLink1Description: http://www.yageo.com/documents/recent/UPY-GPHC_X5R_4V-to-50V_25.pdf?src-supplier=Digi-Key; ComponentLink2URL: http://www.yageo.com/documents/recent/UPY-GPHC_X5R_4V-to-50V_12.pdf?src-supplier=Avnet+Europe; ComponentLink2Description: http://www.yageo.com/documents/recent/UPY-GPHC_X5R_4V-to-50V_12.pdf?src-supplier=Avnet+Europe; ComponentLink3URL: http://www.farnell.com/datasheets/1525783.pdf?src-supplier=Element14; ComponentLink3Description: http://www.farnell.com/datasheets/1525783.pdf?src-supplier=Element14; ComponentLink4URL: http://www.yageo.com/documents/recent/UPY-GPHC_X5R_4V-to-50V_12.pdf?src-supplier=Avnet; ComponentLink4Description: http://www.yageo.com/documents/recent/UPY-GPHC_X5R_4V-to-50V_12.pdf?src-supplier=Avnet; Supplier Part Number 1: 311-1445-1-ND
C17 C30 C32 = GRM188R6YA106MA73D: CAP CER 10UF 35V X5R 0603; Manufacturer: Murata; Tolerance: 20%; Supplier 1: Digi-Key; Manufacturer Part Number: GRM188R6YA106MA73D; Stock 1: 11640; Pricing 1: 1=0.5, 10=0.346, 100=0.2076, 500=0.1557, 1000=0.13148 (USD); Mount: Surface Mount; Case/Package: 0603; Case Code (Metric): 1608; Case Code (Imperial): 0603; Min Operating Temperature: -55°C; Max Operating Temperature: 85°C; Packaging: Tape and Reel; Capacitance: 10uF; Voltage Rating: 35V; Voltage Rating (DC): 35V; Dielectric: X5R; Length: 0.063inch; Width: 0.031inch; Thickness: 0.039inch; ComponentLink1URL: http://search.murata.co.jp/Ceramy/image/img/A01X/G101/ENG/GRM188R6YA106MA73-01.pdf?src-supplier=Digi-Key; ComponentLink1Description: http://search.murata.co.jp/Ceramy/image/img/A01X/G101/ENG/GRM188R6YA106MA73-01.pdf?src-supplier=Digi-Key; ComponentLink2URL: http://search.murata.co.jp/Ceramy/image/img/A01X/G101/ENG/GRM188R6YA106MA73-01.pdf?src-supplier=Mouser; ComponentLink2Description: http://search.murata.co.jp/Ceramy/image/img/A01X/G101/ENG/GRM188R6YA106MA73-01.pdf?src-supplier=Mouser; ComponentLink3URL: https://www.murata.com/~/media/webrenewal/support/library/catalog/products/capacitor/mlcc/c02e.ashx?la=en-us&src-supplier=Digi-Key; ComponentLink3Description: https://www.murata.com/~/media/webrenewal/support/library/catalog/products/capacitor/mlcc/c02e.ashx?la=en-us&src-supplier=Digi-Key; ComponentLink4URL: http://search.murata.co.jp/Ceramy/image/img/A01X/G101/ENG/GRM188R6YA106MA73-01.pdf?src-supplier=Future+Electronics; ComponentLink4Description: http://search.murata.co.jp/Ceramy/image/img/A01X/G101/ENG/GRM188R6YA106MA73-01.pdf?src-supplier=Future+Electronics; ComponentLink5URL: http://search.murata.co.jp/Ceramy/image/img/A01X/G101/ENG/GRM188R6YA106MA73-01.pdf?src-supplier=TTI; ComponentLink5Description: http://search.murata.co.jp/Ceramy/image/img/A01X/G101/ENG/GRM188R6YA106MA73-01.pdf?src-supplier=TTI; Supplier Part Number 1: 490-13248-6-ND
J3 = 0524352471: CONN FFC TOP 24POS 0.50MM R/A; Manufacturer: Molex; Manufacturer Part Number: 52435-2471; Current Rating: 500mA; Voltage Rating: 50V; Number of Positions: 24; Max Voltage Rating (DC): 5.05kV; Gender: Receptacle; Stackable: No; Pitch: 0.5mm; Supplier 1: Digi-Key; RoHS: Yes; Category: FFC / FPC; Stock 1: 1377; Pricing 1: 1=2.22000, 10=1.89200, 100=1.56290 (USD); Contact Material: Bronze; Contact Plating: Gold; Housing Material: Nylon; Min Operating Temperature: -40°C; Max Operating Temperature: 85°C; Packaging: Tape and Reel; Termination: Solder; Package Quantity: 1000; Number of Rows: 1; Number of Contacts: 24; Max Voltage Rating (AC): 50V; Orientation: Right Angle; Contact Location: Top; Number of Circuits: 24; Length: 18.6mm; Depth: 4.7mm; Radiation Hardening: No; REACH SVHC: Unknown; ComponentLink1URL: https://datasheet.ciiva.com/1484/1629121-1484657.pdf?src-supplier=Newark; ComponentLink1Description: https://datasheet.ciiva.com/1484/1629121-1484657.pdf?src-supplier=Newark; ComponentLink2URL: https://datasheet.ciiva.com/5137/0524352471-ffc-fpc-connectors-170593-5137745.pdf?src-supplier=Mouser; ComponentLink2Description: https://datasheet.ciiva.com/5137/0524352471-ffc-fpc-connectors-170593-5137745.pdf?src-supplier=Mouser; ComponentLink3URL: https://datasheet.ciiva.com/30088/283130524352471-ffc-fpc-nectors-30088679.pdf?src-supplier=Onlinecomponents.com; ComponentLink3Description: https://datasheet.ciiva.com/30088/283130524352471-ffc-fpc-nectors-30088679.pdf?src-supplier=Onlinecomponents.com; ComponentLink4URL: https://datasheet.ciiva.com/3925/128320524352471-ffc-fpc-nectors-3925353.pdf?src-supplier=Arrow+Electronics; ComponentLink4Description: https://datasheet.ciiva.com/3925/128320524352471-ffc-fpc-nectors-3925353.pdf?src-supplier=Arrow+Electronics; ComponentLink5URL: https://datasheet.ciiva.com/16659/0524352471-ffc-fpc-connectors-16659957.pdf?src-supplier=Avnet+Europe; ComponentLink5Description: https://datasheet.ciiva.com/16659/0524352471-ffc-fpc-connectors-16659957.pdf?src-supplier=Avnet+Europe; ComponentLink6URL: https://datasheet.ciiva.com/8038/1597798-8038390.pdf?src-supplier=Element14; ComponentLink6Description: https://datasheet.ciiva.com/8038/1597798-8038390.pdf?src-supplier=Element14; ComponentLink7URL: https://datasheet.ciiva.com/10364/0524352471-ffc-fpc-connectors-10364236.pdf?src-supplier=Avnet; ComponentLink7Description: https://datasheet.ciiva.com/10364/0524352471-ffc-fpc-connectors-10364236.pdf?src-supplier=Avnet; Supplier Part Number 1: WM7975CT-ND
J4 = TF31-22S-0.5SH(800): CONN FFC 22POS 0.50MM SMD; Manufacturer: Hirose; Supplier 1: Digi-Key; Manufacturer Part Number: TF31-22S-0.5SH(800); RoHS: Yes; Stock 1: 14399; Pricing 1: 1=0.46000, 10=0.43100, 25=0.36920, 50=0.31360, 100=0.30140, 250=0.27060, 500=0.25830, 1000=0.21525 (USD); RoHS Compliant: No; Supplier Part Number 1: 26-TF31-22S-0.5SH(800)CT-ND
R24 = RC0603FR-070RL: RES SMD 0R, 1%, 0.1W, 0603; Manufacturer: Yageo; Resistance: 0mR; Power Rating: 100mW; Voltage Rating (DC): 50V; Temperature Coefficient: 200ppm/°C; Current Rating: 1A; Working Voltage: 75V; Supplier 1: Arrow Electronics; Manufacturer Part Number: RC0603FR-070RL; RoHS: Yes; Category: Chip SMD Resistors; Stock 1: 1270000; Pricing 1: 5000=0.00320, 5000=0.00490, 50000=0.00450, 500000=0.00250, 2500000=0.00150 (USD); Case/Package: 0603; Number of Pins: 2; Contact Plating: Tin,Matte; Case Code (Metric): 1608; Case Code (Imperial): 0603; Min Operating Temperature: -55°C; Max Operating Temperature: 155°C; Resistor Type: Thick Film; Packaging: Tape and Reel; Tolerance: 1%; Package Quantity: 5000; Voltage Rating: 50V; Number of Terminations: 2; Termination: SMD/SMT; Max Power Dissipation: 100mW; Features: Moisture Resistant; Length: 1.6mm; Width: 0.031inch; Height: 0.45mm; Depth: 0.8mm; Radiation Hardening: No; REACH SVHC: No SVHC; Lead Free: Lead Free; Military Standard: Not; ComponentLink1URL: https://datasheet.ciiva.com/11808/0900766b80f96399-11808172.pdf?src-supplier=RSComponents; ComponentLink1Description: https://datasheet.ciiva.com/11808/0900766b80f96399-11808172.pdf?src-supplier=RSComponents; ComponentLink2URL: https://datasheet.ciiva.com/5558/rc0603-272842-5558341.pdf?src-supplier=Mouser; ComponentLink2Description: https://datasheet.ciiva.com/5558/rc0603-272842-5558341.pdf?src-supplier=Mouser; ComponentLink3URL: https://datasheet.ciiva.com/46382/443971-46382072.pdf?src-supplier=Element14; ComponentLink3Description: https://datasheet.ciiva.com/46382/443971-46382072.pdf?src-supplier=Element14; ComponentLink4URL: https://datasheet.ciiva.com/29721/pyu-r-int-thick-7-29721178.pdf?src-supplier=Digi-Key; ComponentLink4Description: https://datasheet.ciiva.com/29721/pyu-r-int-thick-7-29721178.pdf?src-supplier=Digi-Key; ComponentLink5URL: https://datasheet.ciiva.com/5684/443971-5684699.pdf?src-supplier=Farnell; ComponentLink5Description: https://datasheet.ciiva.com/5684/443971-5684699.pdf?src-supplier=Farnell; ComponentLink6URL: https://datasheet.ciiva.com/7983/443971-7983627.pdf?src-supplier=Element14; ComponentLink6Description: https://datasheet.ciiva.com/7983/443971-7983627.pdf?src-supplier=Element14; ComponentLink7URL: https://datasheet.ciiva.com/29721/pyu-rc0603-51-rohs-l-4-29721179.pdf?src-supplier=Digi-Key; ComponentLink7Description: https://datasheet.ciiva.com/29721/pyu-rc0603-51-rohs-l-4-29721179.pdf?src-supplier=Digi-Key; ComponentLink8URL: https://datasheet.ciiva.com/22643/1868787-22643388.pdf?src-supplier=Element14; ComponentLink8Description: https://datasheet.ciiva.com/22643/1868787-22643388.pdf?src-supplier=Element14; Supplier Part Number 1: RC0603FR-070RL
R25 R26 = RC0603FR-07100RL: RES SMD 100 OHM 1% 1/10W 0603; Manufacturer: Yageo; Temperature Coefficient: 100ppm/°C; Voltage Rating (DC): 50V; Power Rating: 100mW; Supplier 1: Arrow Electronics; Manufacturer Part Number: RC0603FR-07100RL; RoHS: Yes; Category: Chip SMD Resistors; Stock 1: 3800000; Pricing 1: 5000=0.00300, 5000=0.00200, 5000=0.00450, 50000=0.00410, 500000=0.00230, 2500000=0.00140 (USD); Case/Package: 0603; Number of Pins: 2; Case Code (Imperial): 0603; Case Code (Metric): 1608; Size Code: 0603; Min Operating Temperature: -55°C; Max Operating Temperature: 155°C; Resistance: 100R; Tolerance: 1%; Resistor Type: Thick Film; Packaging: Tape and Reel; Voltage Rating: 50V; Termination: SMD/SMT; Features: Moisture Resistant; Series: RC; Max Power Dissipation: 100mW; Number of Terminations: 2; Construction: Rectangular; Resistance Tolerance: 1%; Technology: THICK FILM; Length: 1.6mm; Width: 0.8mm; Height: 0.45mm; Depth: 0.8mm; REACH SVHC: Unknown; Lead Free: Lead Free; RoHS Compliant: Yes; Military Standard: Not; Supplier Part Number 1: RC0603FR-07100RL
R27 = RC0603FR-0733RL: RES SMD 0603 33 Ohm 1% 1/10W; Manufacturer: Yageo; Temperature Coefficient: 100ppm/°C; Voltage Rating (DC): 50V; Power Rating: 100mW; Voltage Rating: 75V; Supplier 1: Digi-Key; Manufacturer Part Number: RC0603FR-0733RL; RoHS: Yes; Category: Chip SMD Resistors; Stock 1: 41; Pricing 1: 1=0.10000, 10=0.02400, 100=0.00970, 1000=0.00436, 2500=0.00378 (USD); Case/Package: 0603; Number of Pins: 2; Case Code (Metric): 1608; Case Code (Imperial): 0603; Weight: 7.1E-05oz; Size Code: 0603; Min Operating Temperature: -55°C; Max Operating Temperature: 155°C; Resistance: 33R; Tolerance: 1%; Resistor Type: Thick Film; Packaging: Tape and Reel; Package Quantity: 1; Number of Terminations: 2; Termination: SMD/SMT; Max Power Dissipation: 100mW; Features: Moisture Resistant; Series: RC; Resistance Tolerance: 1%; Technology: THICK FILM; Construction: Rectangular; Length: 1.6mm; Width: 0.8mm; Height: 0.45mm; Depth: 0.8mm; Lead Pitch: 0.3mm; REACH SVHC: No SVHC; Lead Free: Lead Free; Military Standard: Not; RoHS Compliant: Yes; ComponentLink1URL: https://datasheet.ciiva.com/11808/0900766b80f96399-11808741.pdf?src-supplier=RSComponents; ComponentLink1Description: https://datasheet.ciiva.com/11808/0900766b80f96399-11808741.pdf?src-supplier=RSComponents; ComponentLink2URL: https://datasheet.ciiva.com/2453/pyu-r-int-thick-7-2453952.pdf?src-supplier=Digi-Key; ComponentLink2Description: https://datasheet.ciiva.com/2453/pyu-r-int-thick-7-2453952.pdf?src-supplier=Digi-Key; ComponentLink3URL: https://datasheet.ciiva.com/2453/pyu-r-int-thick-7-2453953.pdf?src-supplier=Digi-Key; ComponentLink3Description: https://datasheet.ciiva.com/2453/pyu-r-int-thick-7-2453953.pdf?src-supplier=Digi-Key; ComponentLink4URL: https://datasheet.ciiva.com/2453/pyu-r-int-thick-7-2453954.pdf?src-supplier=Digi-Key; ComponentLink4Description: https://datasheet.ciiva.com/2453/pyu-r-int-thick-7-2453954.pdf?src-supplier=Digi-Key; ComponentLink5URL: https://datasheet.ciiva.com/7660/38590-7660792.pdf?src-supplier=Element14; ComponentLink5Description: https://datasheet.ciiva.com/7660/38590-7660792.pdf?src-supplier=Element14; ComponentLink6URL: https://datasheet.ciiva.com/15189/getdatasheetpartid-326673-15189708.pdf?src-supplier=Verical; ComponentLink6Description: https://datasheet.ciiva.com/15189/getdatasheetpartid-326673-15189708.pdf?src-supplier=Verical; ComponentLink7URL: https://datasheet.ciiva.com/7746/443971-7746334.pdf?src-supplier=Element14; ComponentLink7Description: https://datasheet.ciiva.com/7746/443971-7746334.pdf?src-supplier=Element14; ComponentLink8URL: https://datasheet.ciiva.com/7746/443971-7746335.pdf?src-supplier=Element14; ComponentLink8Description: https://datasheet.ciiva.com/7746/443971-7746335.pdf?src-supplier=Element14; ComponentLink9URL: https://datasheet.ciiva.com/46395/443971-46395007.pdf?src-supplier=Element14; ComponentLink9Description: https://datasheet.ciiva.com/46395/443971-46395007.pdf?src-supplier=Element14; Supplier Part Number 1: 311-33.0HRCT-ND

## Sheet Memory_Section.SchDoc
size A4; DocumentNumber: 22; SheetNumber: 22; SheetTotal: 28
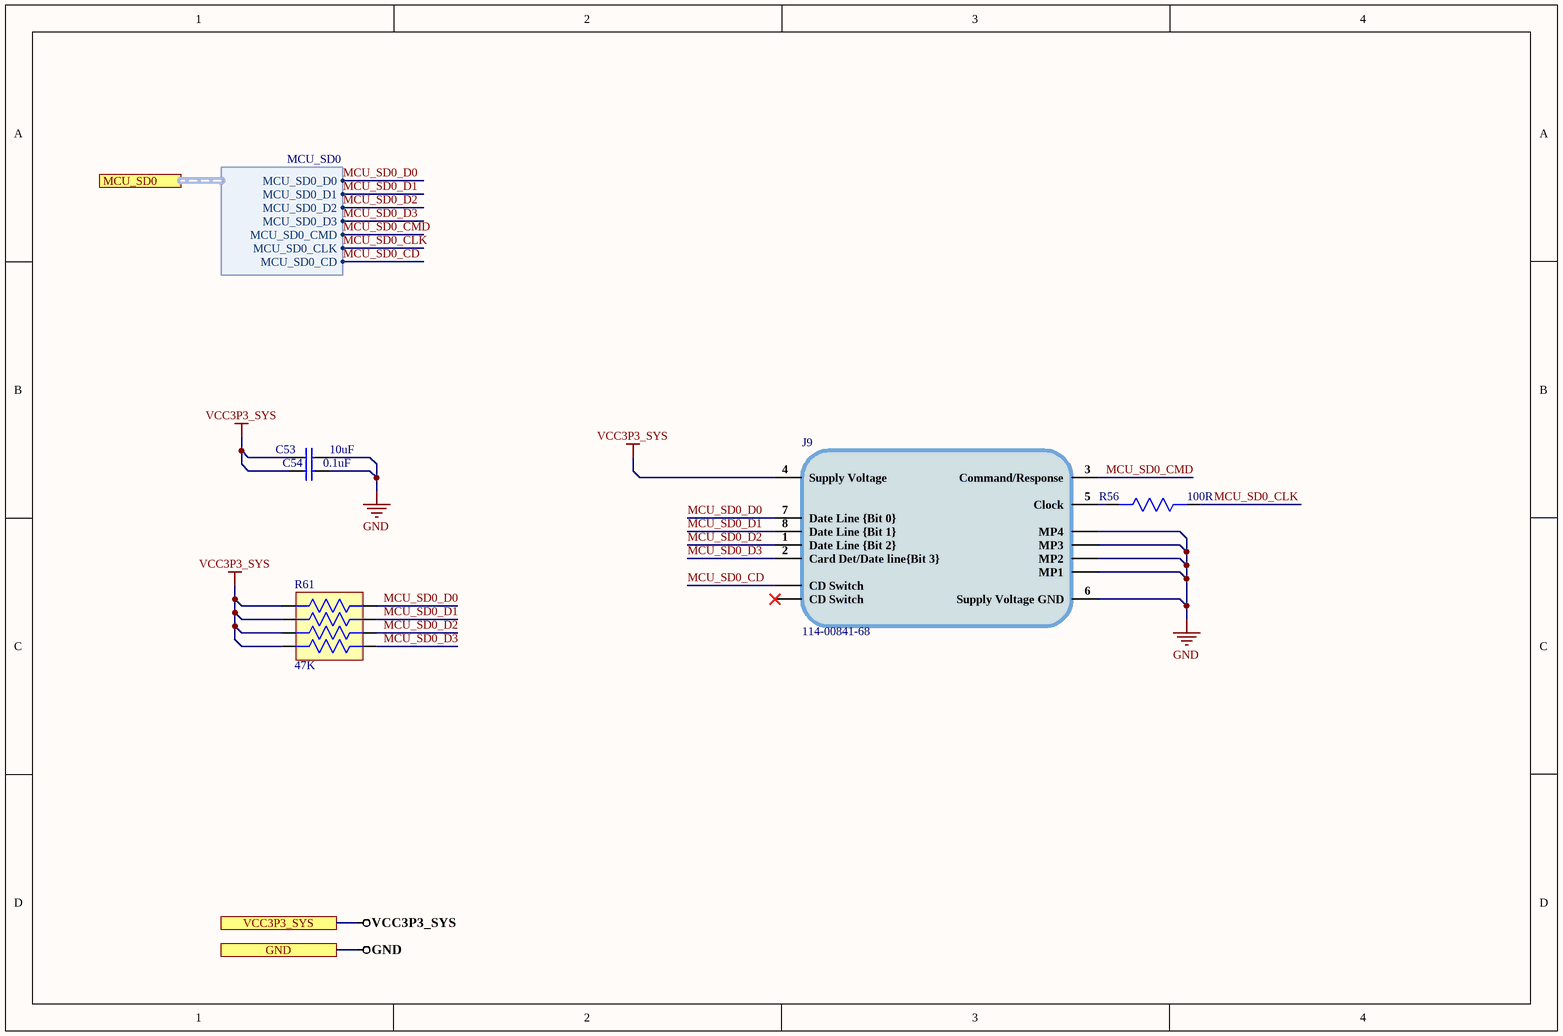
[diagram p20: Memory_Section.SchDoc]

### Parts
C53  10uF  [Cap0603]
C54  0.1uF  [Cap0603]
J9  114-00841-68  [114-00841-68]
R56  100R  [Res0603]
R61  47K  [CAY10-473J4LF]

### Ports
GND, MCU_SD0 (harness MCU_SD0), VCC3P3_SYS

### Harnesses
MCU_SD0: MCU_SD0_D0, MCU_SD0_D1, MCU_SD0_D2, MCU_SD0_D3, MCU_SD0_CMD, MCU_SD0_CLK, MCU_SD0_CD

### Nets
GND: C53.2 C54.2 J9.6(Supply_Voltage_GND) J9.MP1 J9.MP2 J9.MP3 J9.MP4 ; port GND
VCC3P3_SYS: C53.1 C54.1 J9.4(Supply_Voltage) R61.1 R61.2 R61.3 R61.4 ; port VCC3P3_SYS  [project net VCC 3P3_SYS]
MCU_SD0_CD: J9.*CD_Switch(CD_Switch) ; port MCU_SD0.MCU_SD0_CD  [project net MCU_SD0.MCU_SD0_CD]
MCU_SD0_CLK: R56.1 ; port MCU_SD0.MCU_SD0_CLK  [project net MCU_SD0.MCU_SD0_CLK]
MCU_SD0_CMD: J9.3(Command/Response) ; port MCU_SD0.MCU_SD0_CMD  [project net MCU_SD0.MCU_SD0_CMD]
MCU_SD0_D0: J9.7(Date_Line_{Bit_0}) R61.8 ; port MCU_SD0.MCU_SD0_D0  [project net MCU_SD0.MCU_SD0_D0]
MCU_SD0_D1: J9.8(Date_Line_{Bit_1}) R61.7 ; port MCU_SD0.MCU_SD0_D1  [project net MCU_SD0.MCU_SD0_D1]
MCU_SD0_D2: J9.1(Date_Line_{Bit_2}) R61.6 ; port MCU_SD0.MCU_SD0_D2  [project net MCU_SD0.MCU_SD0_D2]
MCU_SD0_D3: J9.2(Card_Det/Date_line{Bit_3}) R61.5 ; port MCU_SD0.MCU_SD0_D3  [project net MCU_SD0.MCU_SD0_D3]
NetJ9_5: J9.5(Clock) R56.2

Not connected (* = marked no-connect by the designer): J9 #CD Switch(CD_Switch)*

### Library data of the parts
C53 = GRM188R6YA106MA73D: as C17 on sheet Camera_Section; Supplier 1: Digi-Key; Manufacturer Part Number: GRM188R6YA106MA73D; Stock 1: 11640; Pricing 1: 1=0.5, 10=0.346, 100=0.2076, 500=0.1557, 1000=0.13148 (USD); Mount: Surface Mount; Case/Package: 0603; Case Code (Metric): 1608; Case Code (Imperial): 0603; Min Operating Temperature: -55°C; Max Operating Temperature: 85°C; Packaging: Tape and Reel; Capacitance: 10uF; Voltage Rating: 35V; Voltage Rating (DC): 35V; Dielectric: X5R; Length: 0.063inch; Width: 0.031inch; Thickness: 0.039inch; ComponentLink1URL: http://search.murata.co.jp/Ceramy/image/img/A01X/G101/ENG/GRM188R6YA106MA73-01.pdf?src-supplier=Digi-Key; ComponentLink1Description: http://search.murata.co.jp/Ceramy/image/img/A01X/G101/ENG/GRM188R6YA106MA73-01.pdf?src-supplier=Digi-Key; ComponentLink2URL: http://search.murata.co.jp/Ceramy/image/img/A01X/G101/ENG/GRM188R6YA106MA73-01.pdf?src-supplier=Mouser; ComponentLink2Description: http://search.murata.co.jp/Ceramy/image/img/A01X/G101/ENG/GRM188R6YA106MA73-01.pdf?src-supplier=Mouser; ComponentLink3URL: https://www.murata.com/~/media/webrenewal/support/library/catalog/products/capacitor/mlcc/c02e.ashx?la=en-us&src-supplier=Digi-Key; ComponentLink3Description: https://www.murata.com/~/media/webrenewal/support/library/catalog/products/capacitor/mlcc/c02e.ashx?la=en-us&src-supplier=Digi-Key; ComponentLink4URL: http://search.murata.co.jp/Ceramy/image/img/A01X/G101/ENG/GRM188R6YA106MA73-01.pdf?src-supplier=Future+Electronics; ComponentLink4Description: http://search.murata.co.jp/Ceramy/image/img/A01X/G101/ENG/GRM188R6YA106MA73-01.pdf?src-supplier=Future+Electronics; ComponentLink5URL: http://search.murata.co.jp/Ceramy/image/img/A01X/G101/ENG/GRM188R6YA106MA73-01.pdf?src-supplier=TTI; ComponentLink5Description: http://search.murata.co.jp/Ceramy/image/img/A01X/G101/ENG/GRM188R6YA106MA73-01.pdf?src-supplier=TTI; Supplier Part Number 1: 490-13248-6-ND
C54 = CC0603ZRY5V9BB104: CAP CER 0.1UF 50V Y5V 0603; Manufacturer: Yageo; Capacitance: 100nF; Tolerance: 80%; Supplier 1: Digi-Key; Manufacturer Part Number: CC0603ZRY5V9BB104; Stock 1: 15000880; Pricing 1: 1=0.1, 10=0.075, 100=0.0334, 500=0.02386, 1000=0.01874 (USD); Mount: Surface Mount; Case/Package: 0603; Number of Pins: 2; Case Code (Metric): 1608; Case Code (Imperial): 0603; Min Operating Temperature: -30°C; Max Operating Temperature: 85°C; Dielectric: Y5V; Voltage Rating: 50V; Package Quantity: 1; Packaging: Tape and Reel; Voltage Rating (DC): 50V; Termination: SMD/SMT; Composition: Ceramic; Voltage: 50V; Length: 1.6mm; Height: 0.8mm; Width: 0.031inch; Thickness: 0.035inch; Depth: 0.8mm; Radiation Hardening: No; REACH SVHC: No SVHC; Lead Free: Lead Free; Halogen Free: Halogen Free; ComponentLink1URL: http://www.yageo.com/documents/recent/UPY-GPHC_Y5V_6.3V-to-50V_8.pdf?src-supplier=Digi-Key; ComponentLink1Description: http://www.yageo.com/documents/recent/UPY-GPHC_Y5V_6.3V-to-50V_8.pdf?src-supplier=Digi-Key; ComponentLink2URL: http://www.yageo.com/documents/recent/UPY-GPHC_Y5V_6.3V-to-50V_5.pdf?src-supplier=Avnet+Europe; ComponentLink2Description: http://www.yageo.com/documents/recent/UPY-GPHC_Y5V_6.3V-to-50V_5.pdf?src-supplier=Avnet+Europe; ComponentLink3URL: https://www.verical.com/server-webapp/html/getDatasheet?partID=403611&src-supplier=Verical; ComponentLink3Description: https://www.verical.com/server-webapp/html/getDatasheet?partID=403611&src-supplier=Verical; ComponentLink4URL: http://www.mouser.com/ds/2/447/Yageo_UPY-GP_NP0_16V-to-50V_9-358835.pdf?src-supplier=Mouser; ComponentLink4Description: http://www.mouser.com/ds/2/447/Yageo_UPY-GP_NP0_16V-to-50V_9-358835.pdf?src-supplier=Mouser; ComponentLink5URL: http://www.farnell.com/datasheets/1132289.pdf?src-supplier=Element14; ComponentLink5Description: http://www.farnell.com/datasheets/1132289.pdf?src-supplier=Element14; Supplier Part Number 1: 311-1343-1-ND
J9 = 114-00841-68: CONN MICRO SD CARD PUSH-PULL R/A; Manufacturer: AMPHENOL ICC (COMMERCIAL PRODUCTS); Connector Type: Connector; Supplier 1: Digi-Key; Manufacturer Part Number: 114-00841-68; Stock 1: 29968; Pricing 1: 1=1.32, 10=1.194, 25=1.1208, 50=1.0722, 100=1.0235, 250=0.926, 500=0.8529 (USD); Mount: Surface Mount; Contact Plating: Gold; Packaging: Tape and Reel; Supplier Part Number 1: 114-00841-68-6-ND
R56 = RC0603FR-07100RL: as R25 on sheet Camera_Section; Supplier 1: Arrow Electronics; Manufacturer Part Number: RC0603FR-07100RL; RoHS: Yes; Category: Chip SMD Resistors; Stock 1: 3800000; Pricing 1: 5000=0.00300, 5000=0.00200, 5000=0.00450, 50000=0.00410, 500000=0.00230, 2500000=0.00140 (USD); Case/Package: 0603; Number of Pins: 2; Case Code (Imperial): 0603; Case Code (Metric): 1608; Size Code: 0603; Min Operating Temperature: -55°C; Max Operating Temperature: 155°C; Resistance: 100R; Tolerance: 1%; Resistor Type: Thick Film; Packaging: Tape and Reel; Voltage Rating: 50V; Termination: SMD/SMT; Features: Moisture Resistant; Series: RC; Max Power Dissipation: 100mW; Number of Terminations: 2; Construction: Rectangular; Resistance Tolerance: 1%; Technology: THICK FILM; Length: 1.6mm; Width: 0.8mm; Height: 0.45mm; Depth: 0.8mm; REACH SVHC: Unknown; Lead Free: Lead Free; RoHS Compliant: Yes; Military Standard: Not; Supplier Part Number 1: RC0603FR-07100RL
R61 = CAY10-473J4LF: RES ARRAY 4 RES 47K OHM 0804; Manufacturer: Bourns; Number of Terminals/Pins: 8; Resistance: 47kR; Number of Resistors: 4; Temperature Coefficient: 250ppm/°C; Power Rating: 125mW; Tolerance: 5%; Voltage Rating: 25V; Circuit Type: Isolated; Power Per Element: 62.5mW; Supplier 1: Digi-Key; Manufacturer Part Number: CAY10-473J4LF; RoHS: Yes; Category: Resistor Arrays; Stock 1: 11037; Pricing 1: 1=0.12000, 10=0.10400, 25=0.07200, 50=0.05600, 100=0.04000, 250=0.03120, 500=0.02480, 1000=0.01760, 5000=0.01360 (USD); Mount: Surface Mount; Case/Package: 0804; Number of Pins: 8; Case Code (Metric): 2010; Case Code (Imperial): 0804; Contact Plating: Tin; Min Operating Temperature: -55°C; Max Operating Temperature: 125°C; Packaging: Tape and Reel; Package Quantity: 1; Number of Elements: 4; Termination: Convex; Voltage Rating (DC): 25V; Series: CAY10; Resistance Tolerance: 5%; Technology: THICK FILM; Length: 2mm; Width: 0.039inch; Height: 0.018inch; Terminal Pitch: 0.5mm; Depth: 1mm; REACH SVHC: No SVHC; Military Standard: Not; RoHS Compliant: Yes; ComponentLink1URL: https://datasheet.ciiva.com/11807/0900766b8064e463-11807137.pdf?src-supplier=RSComponents; ComponentLink1Description: https://datasheet.ciiva.com/11807/0900766b8064e463-11807137.pdf?src-supplier=RSComponents; ComponentLink2URL: https://datasheet.ciiva.com/6494/cay10-6494182.pdf?src-supplier=Digi-Key; ComponentLink2Description: https://datasheet.ciiva.com/6494/cay10-6494182.pdf?src-supplier=Digi-Key; ComponentLink3URL: https://datasheet.ciiva.com/16965/cay10-16965867.pdf?src-supplier=Avnet+Europe; ComponentLink3Description: https://datasheet.ciiva.com/16965/cay10-16965867.pdf?src-supplier=Avnet+Europe; ComponentLink4URL: https://datasheet.ciiva.com/22712/467939-22712716.pdf?src-supplier=Element14; ComponentLink4Description: https://datasheet.ciiva.com/22712/467939-22712716.pdf?src-supplier=Element14; ComponentLink5URL: https://datasheet.ciiva.com/6494/cay10-6494183.pdf?src-supplier=Digi-Key; ComponentLink5Description: https://datasheet.ciiva.com/6494/cay10-6494183.pdf?src-supplier=Digi-Key; ComponentLink6URL: https://datasheet.ciiva.com/6494/cay10-6494184.pdf?src-supplier=Digi-Key; ComponentLink6Description: https://datasheet.ciiva.com/6494/cay10-6494184.pdf?src-supplier=Digi-Key; ComponentLink7URL: https://datasheet.ciiva.com/8370/cay10-8370974.pdf?src-supplier=Avnet; ComponentLink7Description: https://datasheet.ciiva.com/8370/cay10-8370974.pdf?src-supplier=Avnet; ComponentLink8URL: https://datasheet.ciiva.com/48692/001055368-da-01-en-wid-arr-cay10-473j4lf-47k-ohm-4-w-0804-48692103.pdf?src-supplier=Conrad; ComponentLink8Description: https://datasheet.ciiva.com/48692/001055368-da-01-en-wid-arr-cay10-473j4lf-47k-ohm-4-w-0804-48692103.pdf?src-supplier=Conrad; Supplier Part Number 1: CAY10-473J4LFCT-ND

## Sheet LCD_Section.SchDoc
size A4
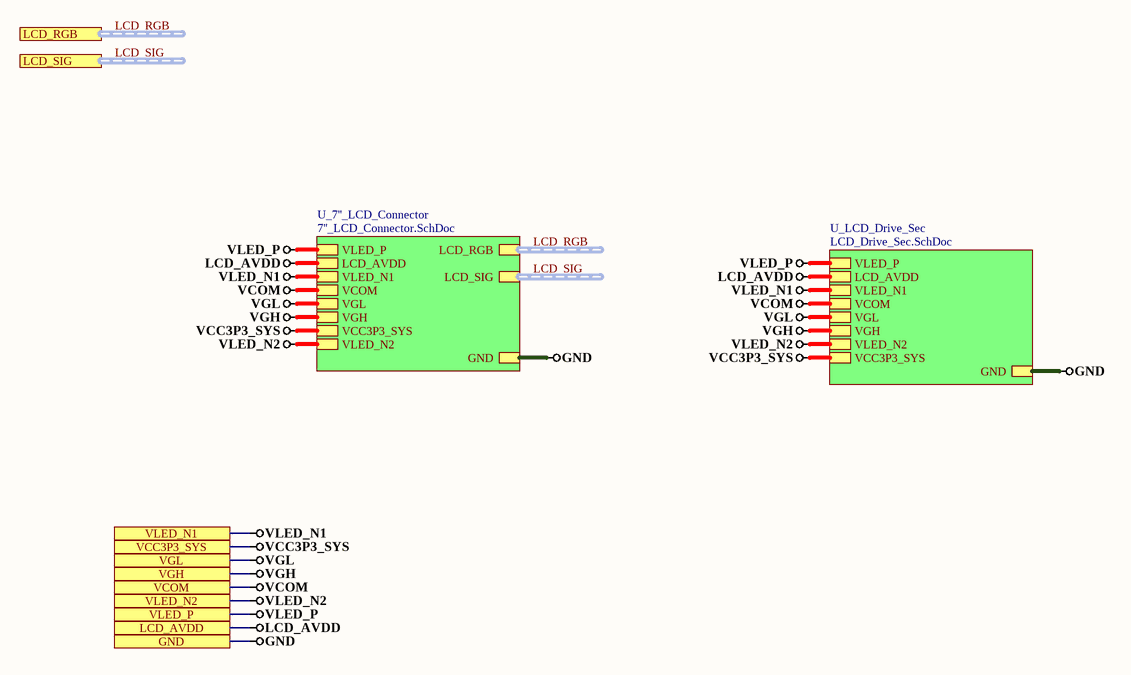
[diagram p21: LCD_Section.SchDoc]

### Sub-sheets
U_7''_LCD_Connector = 7''_LCD_Connector.SchDoc: LCD_RGB (harness LCD_RGB), GND, VLED_P, LCD_AVDD, LCD_SIG (harness LCD_SIG), VLED_N1, VCOM, VGL, VGH, VCC3P3_SYS, VLED_N2
U_LCD_Drive_Sec = LCD_Drive_Sec.SchDoc: GND, VLED_P, LCD_AVDD, VLED_N1, VCOM, VGL, VGH, VLED_N2, VCC3P3_SYS

### Ports
GND, LCD_AVDD, LCD_RGB (harness LCD_RGB), LCD_SIG (harness LCD_SIG), VCC3P3_SYS, VCOM, VGH, VGL, VLED_N1, VLED_N2, VLED_P

### Nets
GND: port GND, sheet U_7''_LCD_Connector/GND, sheet U_LCD_Drive_Sec/GND
LCD_AVDD: port LCD_AVDD, sheet U_7''_LCD_Connector/LCD_AVDD, sheet U_LCD_Drive_Sec/LCD_AVDD
VCC3P3_SYS: port VCC3P3_SYS, sheet U_7''_LCD_Connector/VCC3P3_SYS, sheet U_LCD_Drive_Sec/VCC3P3_SYS  [project net VCC 3P3_SYS]
VCOM: port VCOM, sheet U_7''_LCD_Connector/VCOM, sheet U_LCD_Drive_Sec/VCOM
VGH: port VGH, sheet U_7''_LCD_Connector/VGH, sheet U_LCD_Drive_Sec/VGH
VGL: port VGL, sheet U_7''_LCD_Connector/VGL, sheet U_LCD_Drive_Sec/VGL
VLED_N1: port VLED_N1, sheet U_7''_LCD_Connector/VLED_N1, sheet U_LCD_Drive_Sec/VLED_N1  [project net VLED_N]
VLED_N2: port VLED_N2, sheet U_7''_LCD_Connector/VLED_N2, sheet U_LCD_Drive_Sec/VLED_N2
VLED_P: port VLED_P, sheet U_7''_LCD_Connector/VLED_P, sheet U_LCD_Drive_Sec/VLED_P

### Buses and harness runs
harness LCD_RGB = port LCD_RGB
harness LCD_RGB = sheet U_7''_LCD_Connector/LCD_RGB
harness LCD_SIG = port LCD_SIG
harness LCD_SIG = sheet U_7''_LCD_Connector/LCD_SIG